# Altium schematic sheet 19_CSI.SchDoc
size A3; SheetNumber: 19; SheetTotal: 21
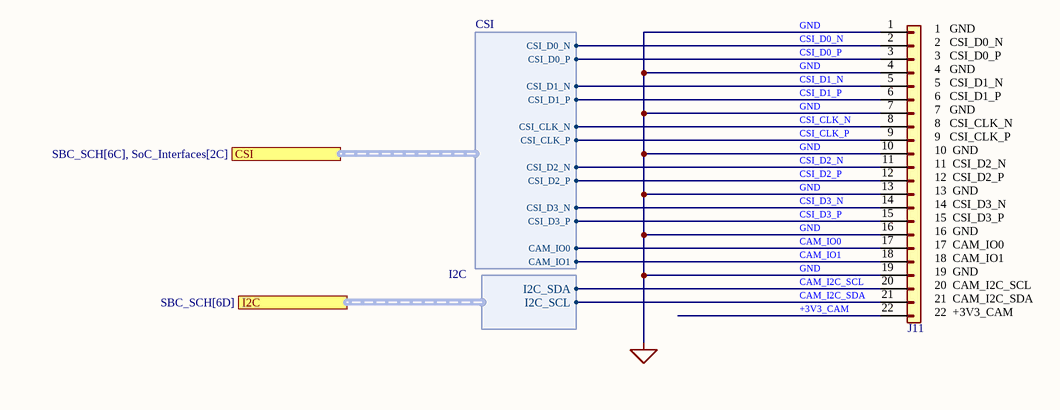
[diagram p0: 19_CSI.SchDoc]

## Parts
J11  Conn_01x22  [5019512230]  (value not drawn)

## Ports
CSI (harness CSI, see SBC_SCH[6C], SoC_Interfaces[2C]), I2C (harness I2C, see SBC_SCH[6D])

## Harnesses
CSI: CSI_D0_N, CSI_D0_P, CSI_D1_N, CSI_D1_P, CSI_CLK_N, CSI_CLK_P, CSI_D2_N, CSI_D2_P, CSI_D3_N, CSI_D3_P, CAM_IO0, CAM_IO1
I2C: I2C_SDA, I2C_SCL

## Nets
GND: J11.1(Pin_1) J11.4(Pin_4) J11.7(Pin_7) J11.10(Pin_10) J11.13(Pin_13) J11.16(Pin_16) J11.19(Pin_19)
+3V3_CAM: J11.22(Pin_22)
CAM_I2C_SCL: J11.20(Pin_20) ; port I2C.I2C_SDA
CAM_I2C_SDA: J11.21(Pin_21) ; port I2C.I2C_SCL
CAM_IO0: J11.17(Pin_17) ; port CSI.CAM_IO0
CAM_IO1: J11.18(Pin_18) ; port CSI.CAM_IO1
CSI_CLK_N: J11.8(Pin_8) ; port CSI.CSI_CLK_N
CSI_CLK_P: J11.9(Pin_9) ; port CSI.CSI_CLK_P
CSI_D0_N: J11.2(Pin_2) ; port CSI.CSI_D0_N
CSI_D0_P: J11.3(Pin_3) ; port CSI.CSI_D0_P
CSI_D1_N: J11.5(Pin_5) ; port CSI.CSI_D1_N
CSI_D1_P: J11.6(Pin_6) ; port CSI.CSI_D1_P
CSI_D2_N: J11.11(Pin_11) ; port CSI.CSI_D2_N
CSI_D2_P: J11.12(Pin_12) ; port CSI.CSI_D2_P
CSI_D3_N: J11.14(Pin_14) ; port CSI.CSI_D3_N
CSI_D3_P: J11.15(Pin_15) ; port CSI.CSI_D3_P

## Notes on the sheet
- (near J11) 1   GND
  2   CSI_D0_N
  3   CSI_D0_P
  4   GND
  5   CSI_D1_N
  6   CSI_D1_P
  7   GND
  8   CSI_CLK_N
  9   CSI_CLK_P
  10  GND
  11  CSI_D2_N
  12  CSI_D2_P
  13  GND
  14  CSI_D3_N
  15  CSI_D3_P
  16  GND
  17  CAM_IO0
  18  CAM_IO1
  19  GND
  20  CAM_I2C_SCL
  21  CAM_I2C_SDA
  22  +3V3_CAM

## Library data of the parts
J11 = Conn_01x22: Generic connector, single row, 01x22, script generated (kicad-library-utils/schlib/autogen/connector/); Value: *; Manufacturer_Name: *; Manufacturer_Part_Number: *